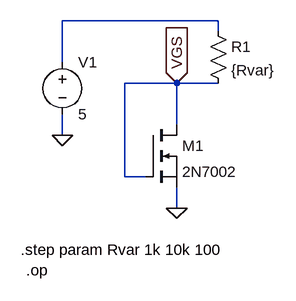
[diagram p0: schematic CracterizacionMosfet2N7000.asc]
CracterizacionMosfet2N7000.asc, the LTspice schematic file:
Version 4.1
SHEET 1 880 680
WIRE 320 48 80 48
WIRE 320 64 320 48
WIRE 80 112 80 48
WIRE 256 144 176 144
WIRE 320 144 256 144
WIRE 256 208 256 144
WIRE 80 224 80 192
WIRE 176 288 176 144
WIRE 208 288 176 288
WIRE 256 336 256 304
FLAG 256 336 0
FLAG 256 144 VGS
IOPIN 256 144 In
FLAG 80 224 0
SYMBOL voltage 80 96 R0
SYMATTR InstName V1
SYMATTR Value 5
SYMBOL res 304 48 R0
SYMATTR InstName R1
SYMATTR Value {Rvar}
SYMBOL nmos 208 208 R0
SYMATTR InstName M1
SYMATTR Value 2N7002
TEXT 16 400 Left 2 !.step param Rvar 1k 10k 100
TEXT 24 432 Left 2 !.op

The netlist it stands for:
* CracterizacionMosfet2N7000.asc
V1 N001 0 5
R1 N001 VGS {Rvar}
M1 VGS VGS 0 0 2N7002
.model NMOS NMOS
.model PMOS PMOS
.lib standard.mos
.step param Rvar 1k 10k 100
.op
.backanno
.end

* Results of the author's LTspice run, read from the files saved beside the schematic
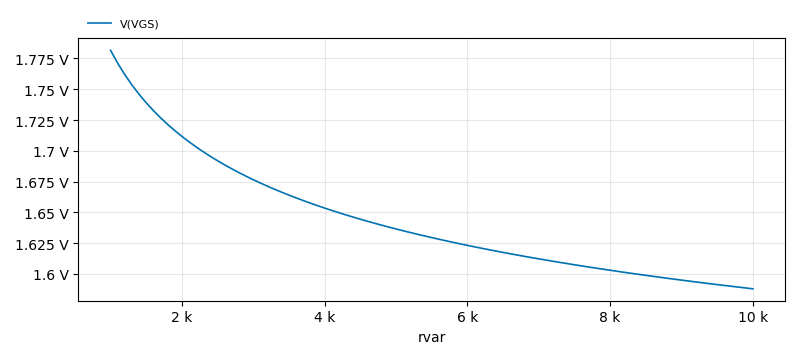
[diagram p1: Operating Point of CracterizacionMosfet2N7000.asc, plotted from the saved traces]
* Operating Point, 1 run:
*   V(VGS): 1.782 V at rvar=1 k, 1.588 V at rvar=10 k, min 1.588 V, max 1.782 V